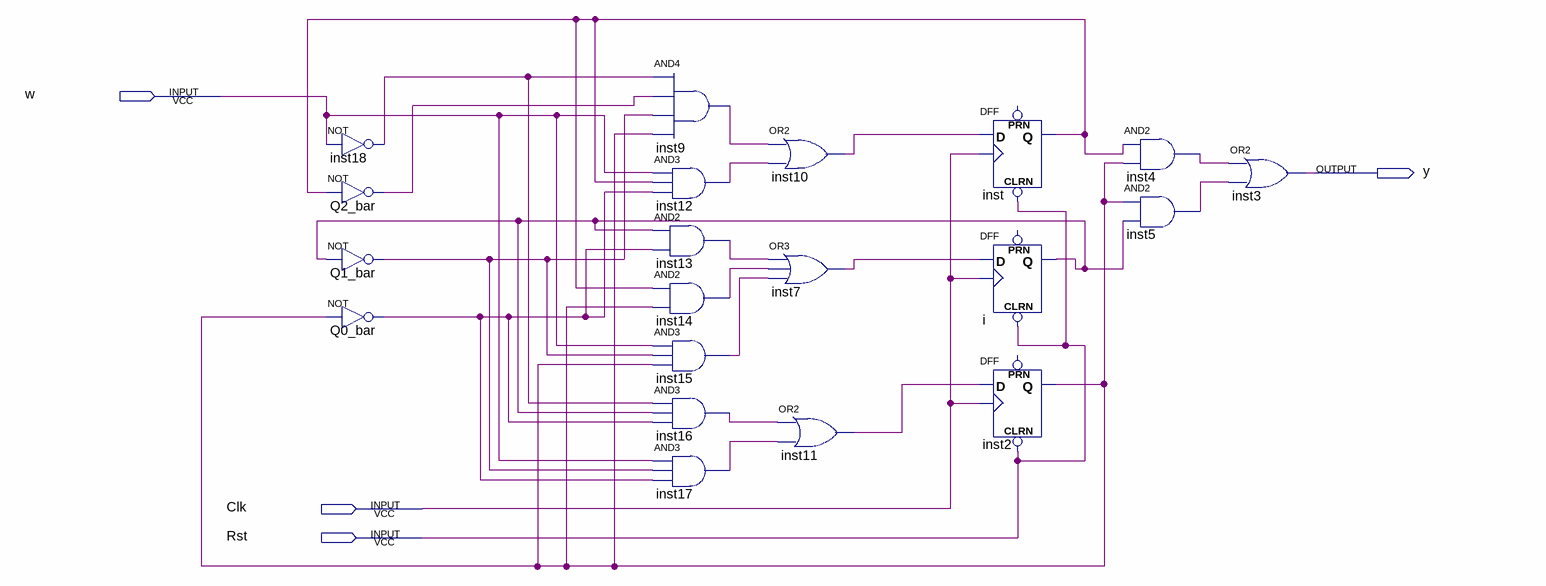
[diagram p0: schematic sheet]
// Quartus schematic MooreFSMDiagram2.bdf as structural Verilog: 20 symbols, 4 pins
module MooreFSMDiagram2 (
  input  w,
  input  Clk,
  input  Rst,
  output y
);

  wire i_q, inst2_q, inst4_out, inst5_out, inst7_out, inst9_out, inst10_out, inst11_out, inst12_out,
       inst13_out, inst14_out, inst15_out, inst16_out, inst17_out, inst18_out, inst_q, Q0_bar_out,
       Q1_bar_out, Q2_bar_out;

  not inst18 (inst18_out, w);
  not Q2_bar (Q2_bar_out, inst_q);
  not Q1_bar (Q1_bar_out, i_q);
  not Q0_bar (Q0_bar_out, inst2_q);
  and inst9 (inst9_out, inst18_out, Q2_bar_out, Q1_bar_out, inst2_q);
  and inst12 (inst12_out, w, inst_q, Q0_bar_out);
  and inst13 (inst13_out, i_q, Q0_bar_out);
  and inst14 (inst14_out, inst_q, inst2_q);
  and inst15 (inst15_out, w, Q1_bar_out, inst2_q);
  and inst16 (inst16_out, inst18_out, i_q, Q0_bar_out);
  and inst17 (inst17_out, w, Q1_bar_out, Q0_bar_out);
  or inst10 (inst10_out, inst9_out, inst12_out);
  or inst7 (inst7_out, inst13_out, inst14_out, inst15_out);
  or inst11 (inst11_out, inst16_out, inst17_out);
  DFF inst (.CLRN(Rst), .CLK(Clk), .D(inst10_out), .Q(inst_q));  // open: PRN
  DFF i (.CLRN(Rst), .CLK(Clk), .D(inst7_out), .Q(i_q));  // open: PRN
  DFF inst2 (.CLRN(Rst), .CLK(Clk), .D(inst11_out), .Q(inst2_q));  // open: PRN
  and inst4 (inst4_out, inst_q, inst2_q);
  and inst5 (inst5_out, inst2_q, i_q);
  or inst3 (y, inst4_out, inst5_out);
endmodule
